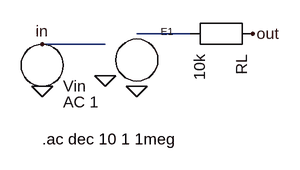
[diagram p0: schematic vcvs_stage_drawn.asc]
vcvs_stage_drawn.asc, the LTspice schematic file:
Version 4
SHEET 1 880 680
WIRE 176 192 272 192
WIRE 320 176 400 176
FLAG 176 192 in
FLAG 496 176 out
FLAG 176 256 0
FLAG 320 256 0
FLAG 272 240 0
SYMBOL e 320 160 R0
SYMATTR InstName E1
SYMATTR Value 2
SYMBOL voltage 176 224 R0
SYMATTR InstName Vin
SYMATTR Value AC 1
SYMBOL res 448 176 R90
SYMATTR InstName RL
SYMATTR Value 10k
TEXT 176 336 Left 2 !.ac dec 10 1 1meg

The netlist it stands for:
* vcvs_stage_drawn.asc
E1 N001 0 in 0 2
Vin in 0 AC 1
RL out N001 10k
.ac dec 10 1 1meg
.backanno
.end